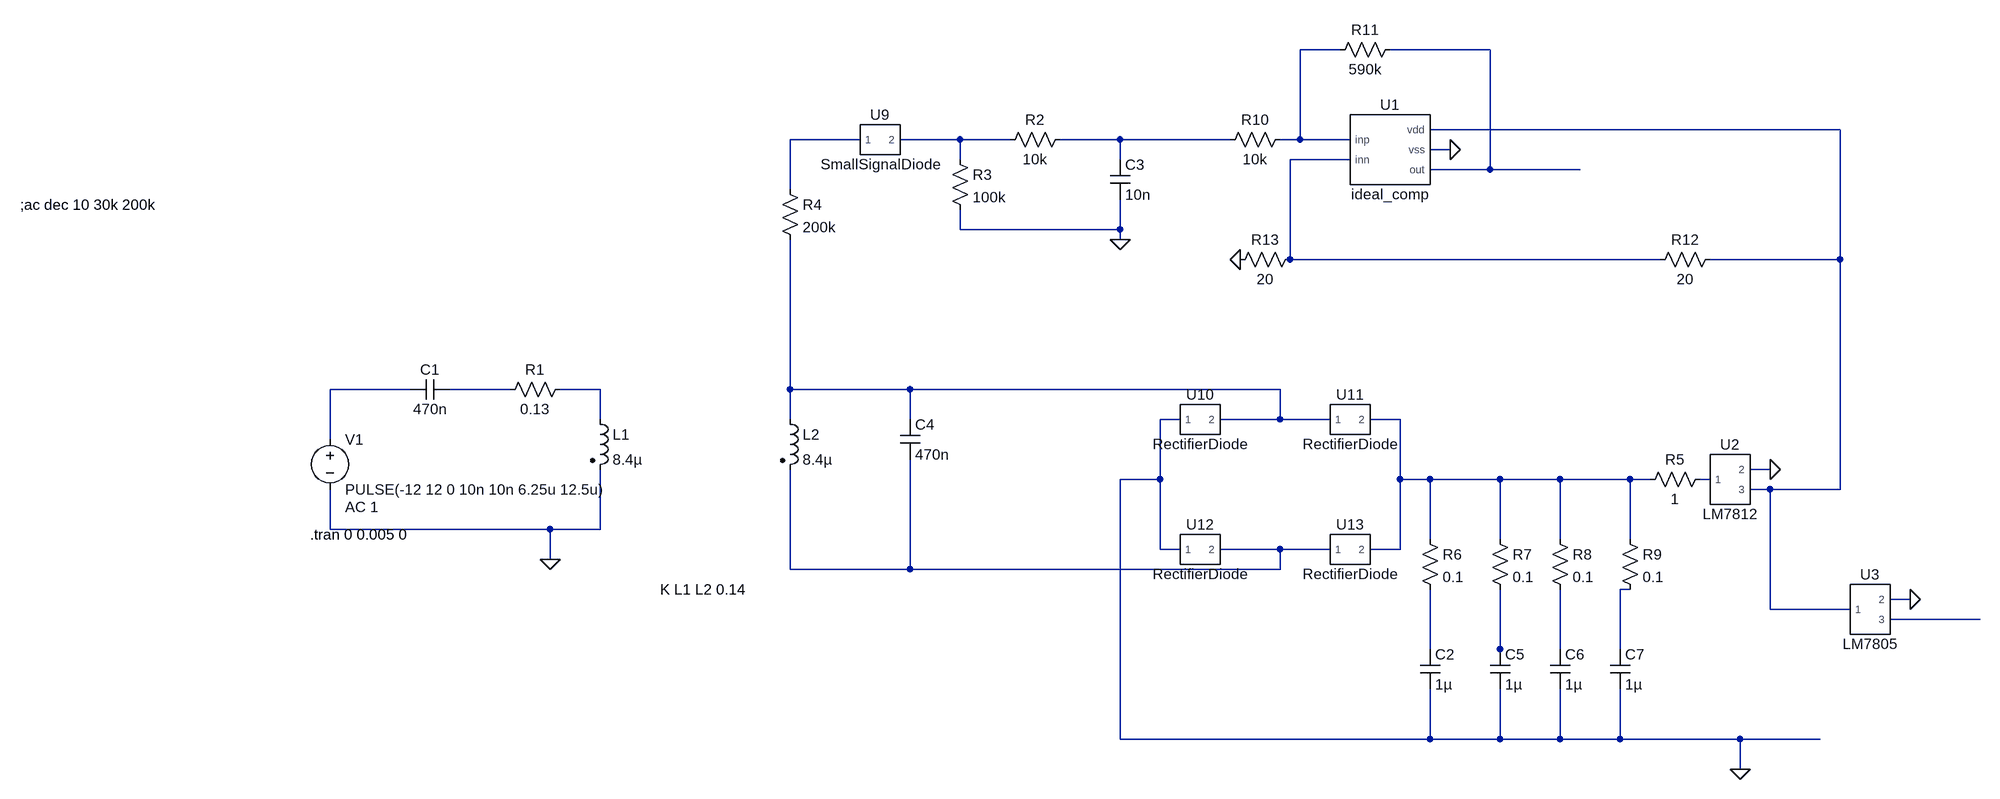
[diagram p0: schematic 2-coil.asc]
2-coil.asc, the LTspice schematic file:
Version 4.1
SHEET 1 2740 680
WIRE 1568 -512 1504 -512
WIRE 1808 -512 1648 -512
WIRE 2368 -384 1712 -384
WIRE 800 -368 688 -368
WIRE 960 -368 864 -368
WIRE 1040 -368 960 -368
WIRE 1216 -368 1120 -368
WIRE 1392 -368 1216 -368
WIRE 1504 -368 1504 -512
WIRE 1504 -368 1472 -368
WIRE 1584 -368 1504 -368
WIRE 1744 -352 1712 -352
WIRE 960 -336 960 -368
WIRE 1216 -336 1216 -368
WIRE 1584 -336 1488 -336
WIRE 1808 -320 1808 -512
WIRE 1808 -320 1712 -320
WIRE 1952 -320 1808 -320
WIRE 688 -288 688 -368
WIRE 960 -224 960 -256
WIRE 1216 -224 1216 -272
WIRE 1216 -224 960 -224
WIRE 1216 -208 1216 -224
WIRE 1488 -176 1488 -336
WIRE 2080 -176 1488 -176
WIRE 2368 -176 2368 -384
WIRE 2368 -176 2160 -176
WIRE 80 32 -48 32
WIRE 240 32 144 32
WIRE 384 32 320 32
WIRE 688 32 688 -208
WIRE 880 32 688 32
WIRE 1472 32 880 32
WIRE 384 80 384 32
WIRE 688 80 688 32
WIRE 880 80 880 32
WIRE 1312 80 1280 80
WIRE 1472 80 1472 32
WIRE 1472 80 1376 80
WIRE 1552 80 1472 80
WIRE 1664 80 1616 80
WIRE -48 112 -48 32
WIRE 2256 160 2224 160
WIRE 1280 176 1280 80
WIRE 1280 176 1216 176
WIRE 1664 176 1664 80
WIRE 1712 176 1664 176
WIRE 1824 176 1712 176
WIRE 1920 176 1824 176
WIRE 2032 176 1920 176
WIRE 2064 176 2032 176
WIRE 2160 176 2144 176
WIRE 2256 192 2224 192
WIRE 2368 192 2368 -176
WIRE 2368 192 2256 192
WIRE -48 256 -48 192
WIRE 304 256 -48 256
WIRE 384 256 384 160
WIRE 384 256 304 256
WIRE 1712 272 1712 176
WIRE 1824 272 1824 176
WIRE 1920 272 1920 176
WIRE 2032 272 2032 176
WIRE 1280 288 1280 176
WIRE 1312 288 1280 288
WIRE 1472 288 1376 288
WIRE 1552 288 1472 288
WIRE 1664 288 1664 176
WIRE 1664 288 1616 288
WIRE 304 304 304 256
WIRE 688 320 688 160
WIRE 880 320 880 144
WIRE 880 320 688 320
WIRE 1472 320 1472 288
WIRE 1472 320 880 320
WIRE 2032 352 2016 352
WIRE 2480 368 2448 368
WIRE 2256 384 2256 192
WIRE 2384 384 2256 384
WIRE 2592 400 2448 400
WIRE 1712 448 1712 352
WIRE 1824 448 1824 352
WIRE 1920 448 1920 352
WIRE 2016 448 2016 352
WIRE 1824 464 1824 448
WIRE 1216 592 1216 176
WIRE 1712 592 1712 512
WIRE 1712 592 1216 592
WIRE 1824 592 1824 512
WIRE 1824 592 1712 592
WIRE 1920 592 1920 512
WIRE 1920 592 1824 592
WIRE 2016 592 2016 512
WIRE 2016 592 1920 592
WIRE 2208 592 2016 592
WIRE 2336 592 2208 592
WIRE 2208 640 2208 592
FLAG 304 304 0
FLAG 2208 640 0
FLAG 1216 -208 0
FLAG 2256 160 0
FLAG 2480 368 0
FLAG 1744 -352 0
FLAG 1408 -176 0
SYMBOL cap 144 16 R90
WINDOW 0 0 32 VBottom 2
WINDOW 3 32 32 VTop 2
SYMATTR InstName C1
SYMATTR Value 470n
SYMBOL res 336 16 R90
WINDOW 0 0 56 VBottom 2
WINDOW 3 32 56 VTop 2
SYMATTR InstName R1
SYMATTR Value 0.13
SYMBOL ind2 368 64 R0
SYMATTR InstName L1
SYMATTR Value 8.4µ
SYMATTR Type ind
SYMBOL ind2 672 64 R0
SYMATTR InstName L2
SYMATTR Value 8.4µ
SYMATTR Type ind
SYMATTR SpiceLine Rser=0.13
SYMBOL voltage -48 96 R0
WINDOW 123 24 124 Left 2
WINDOW 39 0 0 Left 0
SYMATTR Value2 AC 1
SYMATTR InstName V1
SYMATTR Value PULSE(-12 12 0 10n 10n 6.25u 12.5u)
SYMBOL res 672 -304 R0
SYMATTR InstName R4
SYMATTR Value 200k
SYMBOL cap 864 80 R0
SYMATTR InstName C4
SYMATTR Value 470n
SYMBOL cap 1696 448 R0
SYMATTR InstName C2
SYMATTR Value 1µ
SYMATTR SpiceLine Rser=0
SYMBOL res 2160 160 R90
WINDOW 0 0 56 VBottom 2
WINDOW 3 32 56 VTop 2
SYMATTR InstName R5
SYMATTR Value 1
SYMBOL cap 1808 448 R0
SYMATTR InstName C5
SYMATTR Value 1µ
SYMATTR SpiceLine Rser=0
SYMBOL cap 1904 448 R0
SYMATTR InstName C6
SYMATTR Value 1µ
SYMATTR SpiceLine Rser=0
SYMBOL cap 2000 448 R0
SYMATTR InstName C7
SYMATTR Value 1µ
SYMATTR SpiceLine Rser=0
SYMBOL res 1696 256 R0
SYMATTR InstName R6
SYMATTR Value 0.1
SYMBOL res 1808 256 R0
SYMATTR InstName R7
SYMATTR Value 0.1
SYMBOL res 1904 256 R0
SYMATTR InstName R8
SYMATTR Value 0.1
SYMBOL res 2016 256 R0
SYMATTR InstName R9
SYMATTR Value 0.1
SYMBOL res 1136 -384 R90
WINDOW 0 0 56 VBottom 2
WINDOW 3 32 56 VTop 2
SYMATTR InstName R2
SYMATTR Value 10k
SYMBOL cap 1200 -336 R0
SYMATTR InstName C3
SYMATTR Value 10n
SYMBOL res 944 -352 R0
SYMATTR InstName R3
SYMATTR Value 100k
SYMBOL res 1488 -384 R90
WINDOW 0 0 56 VBottom 2
WINDOW 3 32 56 VTop 2
SYMATTR InstName R10
SYMATTR Value 10k
SYMBOL res 1664 -528 R90
WINDOW 0 0 56 VBottom 2
WINDOW 3 32 56 VTop 2
SYMATTR InstName R11
SYMATTR Value 590k
SYMBOL res 2176 -192 R90
WINDOW 0 0 56 VBottom 2
WINDOW 3 32 56 VTop 2
SYMATTR InstName R12
SYMATTR Value 20
SYMBOL res 1504 -192 R90
WINDOW 0 0 56 VBottom 2
WINDOW 3 32 56 VTop 2
SYMATTR InstName R13
SYMATTR Value 20
SYMBOL SmallSignalDiode 832 -368 R0
SYMATTR InstName U9
SYMBOL RectifierDiode 1344 80 R0
SYMATTR InstName U10
SYMBOL RectifierDiode 1584 80 R0
SYMATTR InstName U11
SYMBOL RectifierDiode 1344 288 R0
SYMATTR InstName U12
SYMBOL RectifierDiode 1584 288 R0
SYMATTR InstName U13
SYMBOL ideal_comp 1648 -352 R0
SYMATTR InstName U1
SYMBOL LM7812 2192 176 R0
SYMATTR InstName U2
SYMBOL LM7805 2416 384 R0
SYMATTR InstName U3
TEXT -80 264 Left 2 !.tran 0 0.005 0
TEXT 480 352 Left 2 !K L1 L2 0.14
TEXT -544 -264 Left 2 !;ac dec 10 30k 200k

The netlist it stands for:
* 2-coil.asc
C1 N009 N008 470n
R1 N010 N009 0.13
L1 N010 0 8.4µ
L2 N011 N014 8.4µ Rser=0.13
V1 N008 0 PULSE(-12 12 0 10n 10n 6.25u 12.5u) AC 1
R4 N004 N011 200k
C4 N011 N014 470n
C2 N017 0 1µ Rser=0
R5 N013 N012 1
C5 N018 0 1µ Rser=0
C6 N019 0 1µ Rser=0
C7 N015 0 1µ Rser=0
R6 N012 N017 0.1
R7 N012 N018 0.1
R8 N012 N019 0.1
R9 N012 N015 0.1
R2 N006 N005 10k
C3 N006 0 10n
R3 N005 0 100k
R10 N001 N006 10k
R11 N002 N001 590k
R12 N003 N007 20
R13 N007 0 20
X§U9 N004 N005 SmallSignalDiode  ; pins 1 2
X§U10 0 N011 RectifierDiode  ; pins 1 2
X§U11 N011 N012 RectifierDiode  ; pins 1 2
X§U12 0 N014 RectifierDiode  ; pins 1 2
X§U13 N014 N012 RectifierDiode  ; pins 1 2
X§U1 N001 N007 N003 0 N002 ideal_comp  ; pins inp inn vdd vss out
X§U2 N013 0 N003 LM7812  ; pins 1 2 3
X§U3 N003 0 N016 LM7805  ; pins 1 2 3
.tran 0 0.005 0
K L1 L2 0.14
;ac dec 10 30k 200k
.lib SmallSignalDiode.spi
.lib RectifierDiode.spi
.lib Ideal_comp.spi
.lib LM7812.spi
.lib LM7805.spi
.backanno
.end